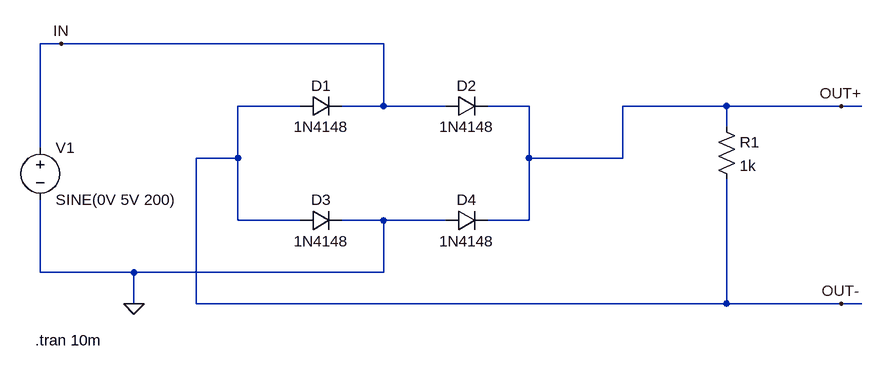
[diagram p0: schematic Example-7-4-a.asc]
Example-7-4-a.asc, the LTspice schematic file:
Version 4.1
SHEET 1 8852 680
WIRE 7600 -112 7568 -112
WIRE 8096 -112 7600 -112
WIRE 7968 -16 7872 -16
WIRE 8096 -16 8096 -112
WIRE 8096 -16 8032 -16
WIRE 8192 -16 8096 -16
WIRE 8320 -16 8256 -16
WIRE 8624 -16 8464 -16
WIRE 8800 -16 8624 -16
WIRE 8832 -16 8800 -16
WIRE 8624 16 8624 -16
WIRE 7568 48 7568 -112
WIRE 7872 64 7872 -16
WIRE 7872 64 7808 64
WIRE 8320 64 8320 -16
WIRE 8464 64 8464 -16
WIRE 8464 64 8320 64
WIRE 7872 160 7872 64
WIRE 7968 160 7872 160
WIRE 8096 160 8032 160
WIRE 8192 160 8096 160
WIRE 8320 160 8320 64
WIRE 8320 160 8256 160
WIRE 7568 240 7568 128
WIRE 7712 240 7568 240
WIRE 8096 240 8096 160
WIRE 8096 240 7712 240
WIRE 7712 288 7712 240
WIRE 7808 288 7808 64
WIRE 8624 288 8624 96
WIRE 8624 288 7808 288
WIRE 8800 288 8624 288
WIRE 8832 288 8800 288
FLAG 7712 288 0
FLAG 7600 -112 IN
FLAG 8800 -16 OUT+
FLAG 8800 288 OUT-
SYMBOL voltage 7568 32 R0
WINDOW 123 0 0 Left 0
WINDOW 39 0 0 Left 0
SYMATTR InstName V1
SYMATTR Value SINE(0V 5V 200)
SYMBOL diode 7968 0 R270
WINDOW 0 32 32 VTop 2
WINDOW 3 0 32 VBottom 2
SYMATTR InstName D1
SYMATTR Value 1N4148
SYMBOL diode 8192 0 R270
WINDOW 0 32 32 VTop 2
WINDOW 3 0 32 VBottom 2
SYMATTR InstName D2
SYMATTR Value 1N4148
SYMBOL diode 7968 176 R270
WINDOW 0 32 32 VTop 2
WINDOW 3 0 32 VBottom 2
SYMATTR InstName D3
SYMATTR Value 1N4148
SYMBOL diode 8192 176 R270
WINDOW 0 32 32 VTop 2
WINDOW 3 0 32 VBottom 2
SYMATTR InstName D4
SYMATTR Value 1N4148
SYMBOL res 8608 0 R0
SYMATTR InstName R1
SYMATTR Value 1k
TEXT 7560 344 Left 2 !.tran 10m

The netlist it stands for:
* Example-7-4-a.asc
V1 IN 0 SINE(0V 5V 200)
D1 OUT- IN 1N4148
D2 IN OUT+ 1N4148
D3 OUT- 0 1N4148
D4 0 OUT+ 1N4148
R1 OUT+ OUT- 1k
.model D D
.lib standard.dio
.tran 10m
.backanno
.end

* Results of the author's LTspice run, read from the files saved beside the schematic
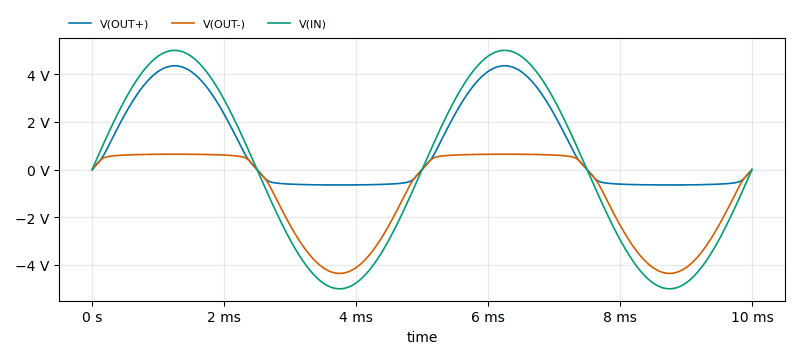
[diagram p1: Transient Analysis of Example-7-4-a.asc, plotted from the saved traces]
* Transient Analysis, 1 run:
*   V(OUT+): min -645.7 mV, max 4.354 V, average 1.025 V, rms 2.149 V, last 0 V
*   V(OUT-): min -4.354 V, max 645.7 mV, average -1.025 V, rms 2.149 V, last 0 V
*   V(IN): min -5 V, max 5 V, average 0 V, rms 3.536 V, last 0 V